# Altium schematic sheet Power-Sheet.SchDoc (part 2 of 2)
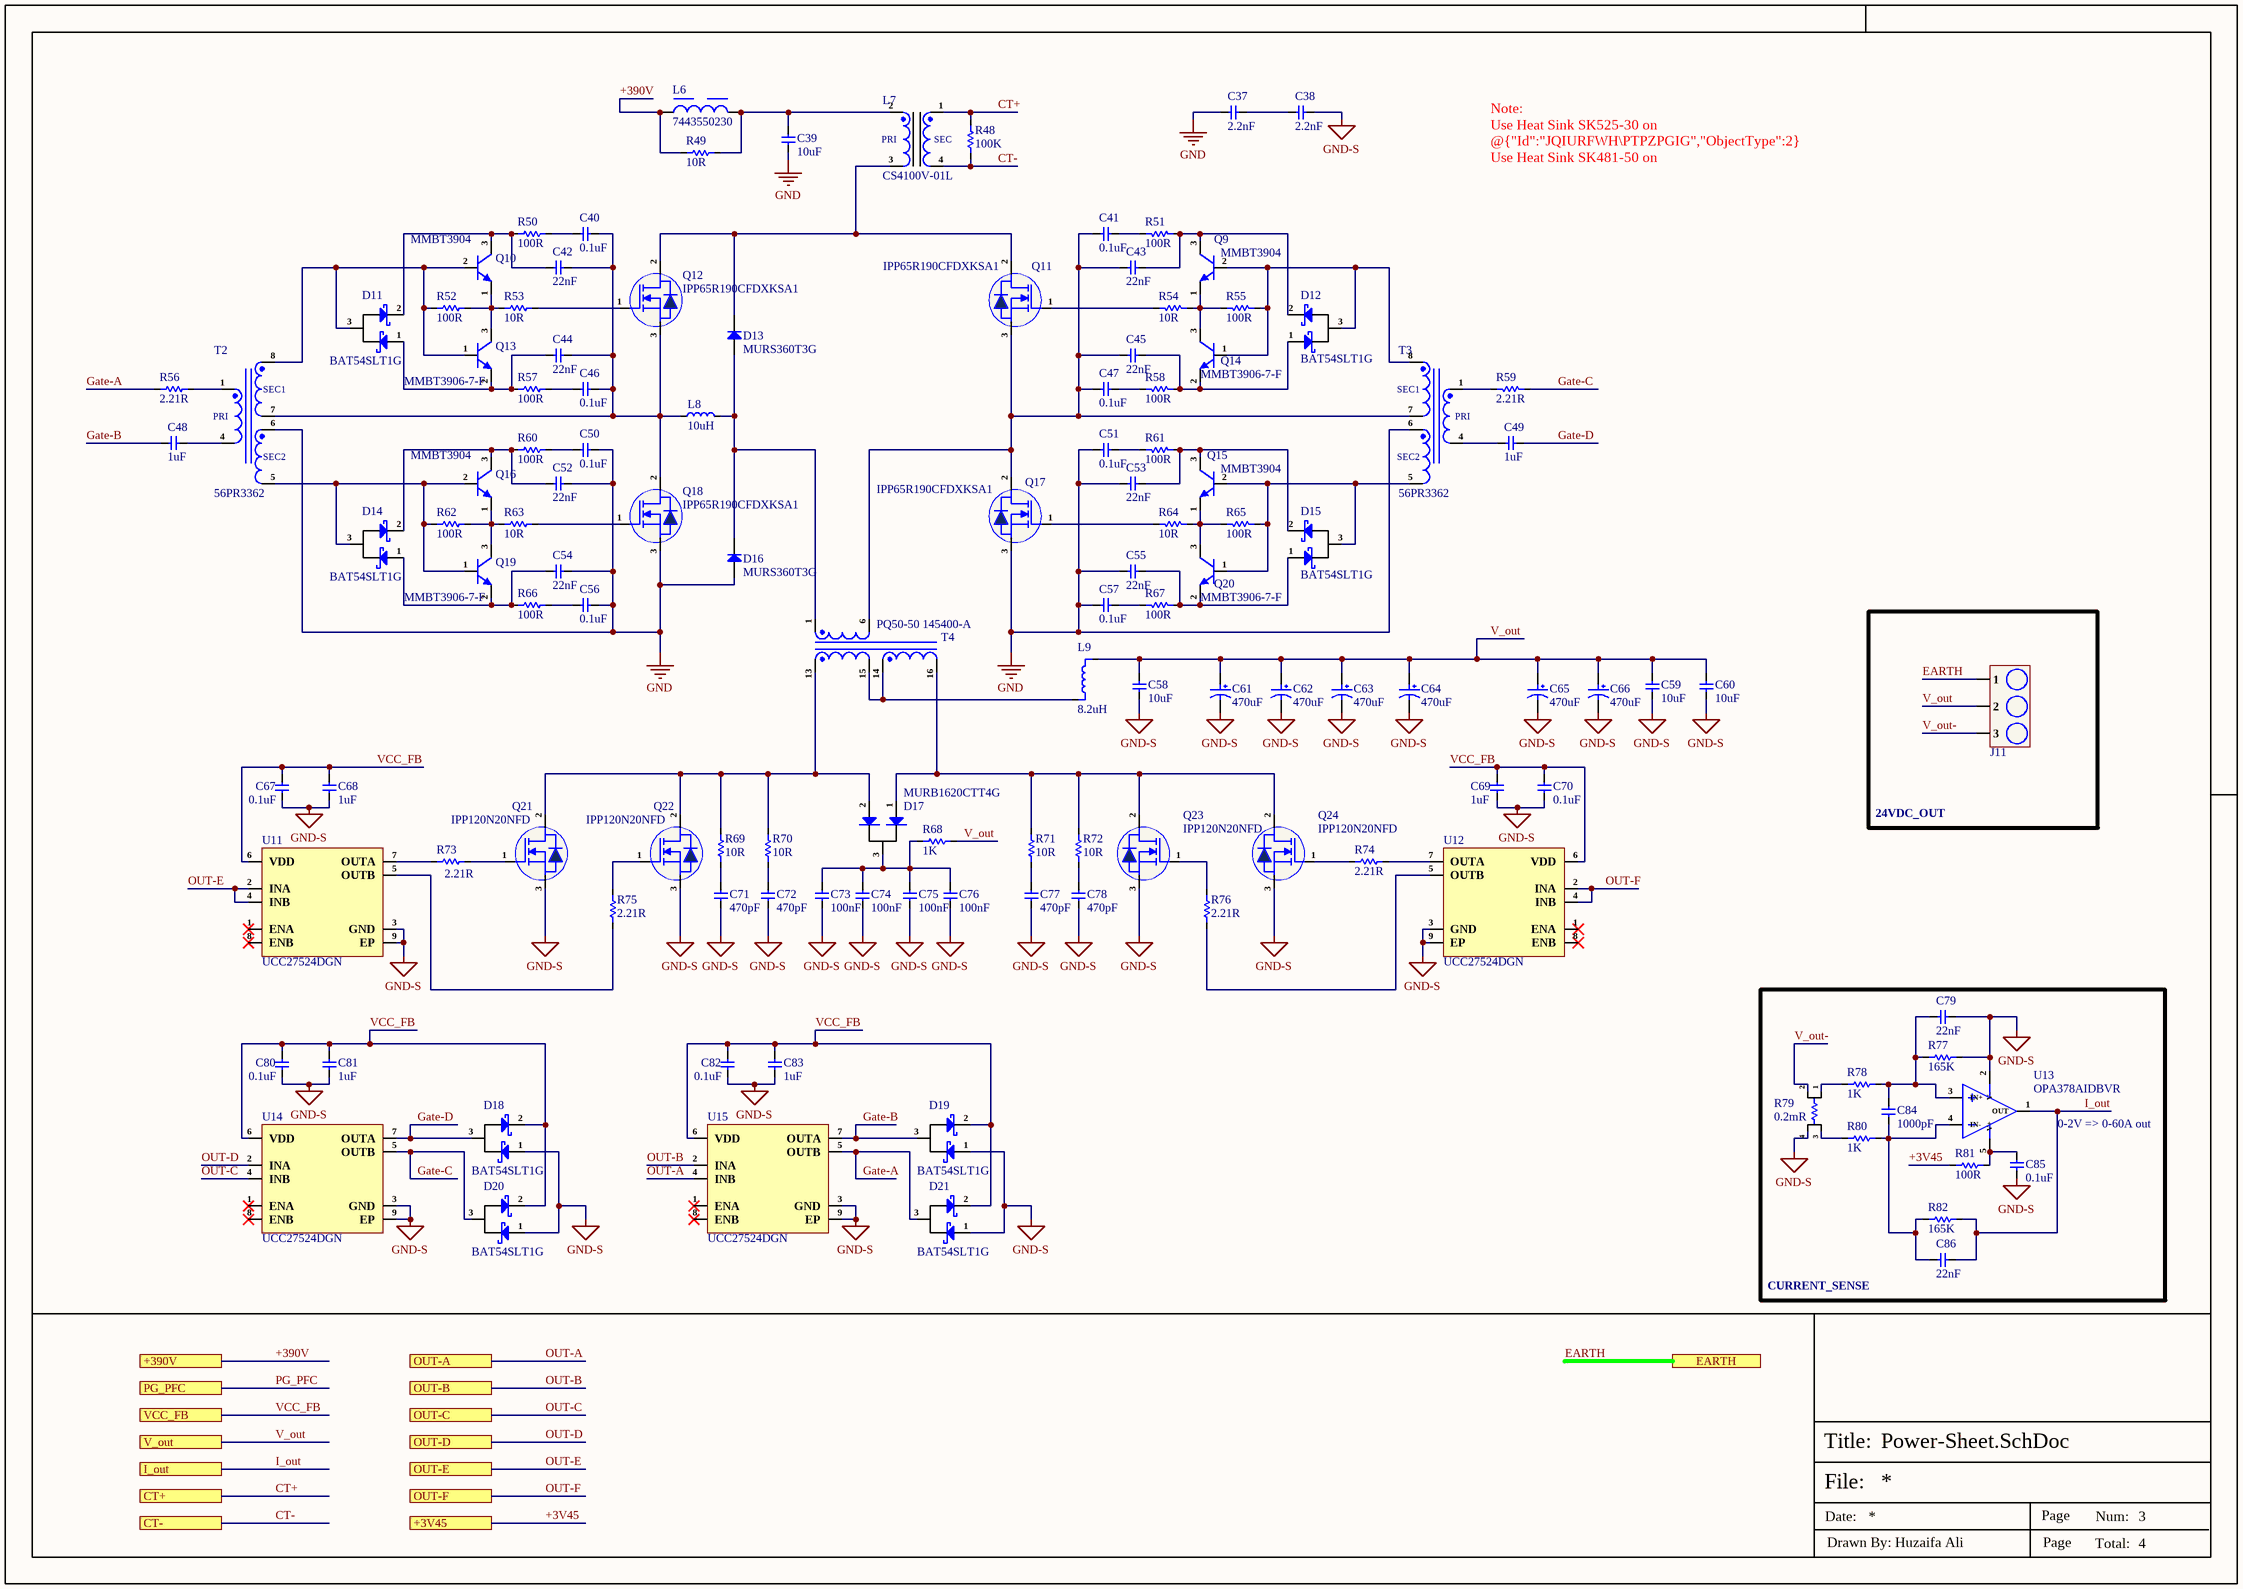
[diagram p1: Power-Sheet.SchDoc]

## Library data of the parts
C37 C38 = DE1E3RA222MN4AP01F: CAP CER 2200PF 1.5KV RADIAL; Manufacturer: Murata; Item Type: Capacitors; Supplier: Future Electronics; LCSC Part Number: C1622500; Manufacturer Part Number: DE1E3RA222MN4AP01F; RoHS: Yes; Stock: 1200; Pricing: 600=0.0835, 2400=0.0795, 9000=0.0758, 18000=0.074, 45000=0.0699 (USD); ComponentLink1URL: https://search.murata.co.jp/Ceramy/image/img/A01X/G101/ENG/DE1_RA_P01F_E.pdf?src-supplier=Digikey; ComponentLink1Description: https://search.murata.co.jp/Ceramy/image/img/A01X/G101/ENG/DE1_RA_P01F_E.pdf?src-supplier=Digikey; ComponentLink2URL: http://search.murata.co.jp/Ceramy/image/img/A01X/G101/ENG/DE1_RA_P01F_E.pdf?src-supplier=Digikey; ComponentLink2Description: http://search.murata.co.jp/Ceramy/image/img/A01X/G101/ENG/DE1_RA_P01F_E.pdf?src-supplier=Digikey
C39 = B32774X5106K000: FILM CAP MKP DC FILTERING - 600V; Manufacturer: TDK; Item Type: Capacitor; Supplier: Digikey; Supplier Part Number: 495-B32774X5106K000-ND; Manufacturer Part Number: B32774X5106K000; RoHS: No; Pricing: 1=4.3, 10=2.896, 50=2.3266, 224=1.97978, 672=1.80198, 1120=1.77575 (USD)
C40 C41 C46 C47 C50 C51 C56 C57 C67 C70 C80 C82 C85 = CL10B104KB8WPNC: CAP CER 0.1UF 50V X7R 0603; Item Type: Capacitor; Material: 4241ConductorMaterial; Value: 100nF; Tolerance: 10%; LCSC Part Number: C307348; ComponentLink1Description: LCSC; Supplier: Rs; Supplier Part Number: 2575919; RoHS: Yes; Category: Ceramic Capacitors; Stock: 400; Pricing: 100=0.021, 500=0.019, 1000=0.015, 2000=0.01 (GBP); Mounting Technology: Surface Mount; Case/Package: 0603; Case Code (Metric): 1608; Case Code (Imperial): 0603; Min Operating Temperature: -55°C; Max Operating Temperature: 125°C; Packaging: Cut Tape; Voltage Rating: 50V; Series: CL; Voltage Rating (DC): 50V; Height: 900um; Ratings: AEC-Q200; RoHS Compliant: Yes; Lead Free: 5697LeadFree; ComponentLink2URL: http://www.farnell.com/datasheets/2710560.pdf?src-supplier=Farnell; ComponentLink2Description: http://www.farnell.com/datasheets/2710560.pdf?src-supplier=Farnell; ComponentLink3URL: http://www.samsungsem.com/kr/support/product-search/mlcc/CL10B104KB8WPNC.jsp?src-supplier=Digi-Key; ComponentLink3Description: http://www.samsungsem.com/kr/support/product-search/mlcc/CL10B104KB8WPNC.jsp?src-supplier=Digi-Key; ComponentLink4URL: http://www.farnell.com/datasheets/2710560.pdf?src-supplier=Element14; ComponentLink4Description: http://www.farnell.com/datasheets/2710560.pdf?src-supplier=Element14; ComponentLink5URL: https://datasheet.octopart.com/CL10B104KB8WPNC-Samsung-Electro-Mechanics-datasheet-120093645.pdf?src-supplier=Future+Electronics; ComponentLink5Description: https://datasheet.octopart.com/CL10B104KB8WPNC-Samsung-Electro-Mechanics-datasheet-120093645.pdf?src-supplier=Future+Electronics; ComponentLink6URL: http://www.farnell.com/datasheets/2710560.pdf?src-supplier=Newark; ComponentLink6Description: http://www.farnell.com/datasheets/2710560.pdf?src-supplier=Newark; ComponentLink7URL: http://www.samsungsem.com/servlet/FileDownload?type=spec&file=CL10B104KB8WPNC.pdf&src-supplier=Avnet; ComponentLink7Description: http://www.samsungsem.com/servlet/FileDownload?type=spec&file=CL10B104KB8WPNC.pdf&src-supplier=Avnet; ComponentLink8URL: https://datasheet.octopart.com/CL10B104KB8WPNC-Samsung-datasheet-8326407.pdf?src-supplier=TME; ComponentLink8Description: https://datasheet.octopart.com/CL10B104KB8WPNC-Samsung-datasheet-8326407.pdf?src-supplier=TME
C42-C45 C52-C55 C79 C86 = CGA3E2X7R2A223K080AA: CAP CER 0.022UF 100V X7R 0603; Manufacturer: TDK; Tolerance: 10%; Item Type: Capacitor; Supplier 1: Digi-Key; Manufacturer Part Number: CGA3E2X7R2A223K080AA; RoHS: Yes; Category: Ceramic Capacitors; Stock 1: 56079; Pricing 1: 1=0.11000, 10=0.07600, 50=0.04340, 100=0.03590, 500=0.02516, 1000=0.02083 (USD); Mount: Surface Mount; Case/Package: 0603; Case Code (Metric): 1608; Case Code (Imperial): 0603; Weight: 7.1E-05oz; Min Operating Temperature: -55°C; Max Operating Temperature: 125°C; Capacitance: 22nF; Voltage Rating: 100V; Packaging: Tape and Reel; Voltage Rating (DC): 100V; Dielectric: X7R; Termination: SMD/SMT; Series: CGA; Package Quantity: 1; Resistor Type: Ceramic; Length: 1.6mm; Width: 0.031inch; Height: 0.8mm; Thickness: 0.035inch; Depth: 0.8mm; Ratings: AEC-Q200; RoHS Compliant: Yes; REACH SVHC: No SVHC; ComponentLink1URL: https://datasheet.ciiva.com/22725/1735406-22725648.pdf?src-supplier=Element14; ComponentLink1Description: https://datasheet.ciiva.com/22725/1735406-22725648.pdf?src-supplier=Element14; ComponentLink2URL: https://datasheet.ciiva.com/24218/cga3e2x7r2a223k080aa-266292-24218959.pdf?src-supplier=Mouser; ComponentLink2Description: https://datasheet.ciiva.com/24218/cga3e2x7r2a223k080aa-266292-24218959.pdf?src-supplier=Mouser; ComponentLink3URL: https://datasheet.ciiva.com/7975/1807242-7975349.pdf?src-supplier=Element14; ComponentLink3Description: https://datasheet.ciiva.com/7975/1807242-7975349.pdf?src-supplier=Element14; Supplier Part Number 1: 445-5814-1-ND; LCSC Part Number: C2167165
C48 C49 C68 C69 C81 C83 = C1608X7R1E105K080AB: CAP CER 1UF 25V X7R 0603; Manufacturer: TDK; Item Type: Capacitors; Material: 4241ConductorMaterial; Tolerance: 10%; Supplier: Digikey; Manufacturer Part Number: C1608X7R1E105K080AB; RoHS: Yes; Stock: 239206; Pricing: 1=0.18, 10=0.103, 50=0.0722, 100=0.0627, 500=0.04664, 1000=0.04163 (USD); Mounting Technology: Surface Mount; Case/Package: 0603; Case Code (Metric): 1608; Case Code (Imperial): 0603; Dielectric Material: 4241ConductorMaterial; Min Operating Temperature: -55°C; Max Operating Temperature: 125°C; Value: 1uF; Package Quantity: 1; Voltage Rating: 25V; Packaging: Tape and Reel; Dielectric: X7R; Voltage: 25V; Series: C; Construction: Flat; Length: 1.6mm; Width: 0.031inch; Height: 0.8mm; Thickness: 0.037inch; Depth: 0.8mm; Radiation Hardening: No; Reach SVHC Compliant: No; Lead Free: Lead Free; RoHS Compliant: Yes; ComponentLink1URL: https://datasheet.ciiva.com/23802/1796654-23802776.pdf?src-supplier=Newark; ComponentLink1Description: https://datasheet.ciiva.com/23802/1796654-23802776.pdf?src-supplier=Newark; ComponentLink2URL: https://datasheet.ciiva.com/22725/1913358-22725530.pdf?src-supplier=Element14; ComponentLink2Description: https://datasheet.ciiva.com/22725/1913358-22725530.pdf?src-supplier=Element14; ComponentLink3URL: https://datasheet.ciiva.com/28693/mlcc-commercial-general-en-28693447.pdf?src-supplier=Element14; ComponentLink3Description: https://datasheet.ciiva.com/28693/mlcc-commercial-general-en-28693447.pdf?src-supplier=Element14; ComponentLink4URL: https://datasheet.ciiva.com/6290/tdkmlcccaprange-6290854.pdf?src-supplier=Digikey; ComponentLink4Description: https://datasheet.ciiva.com/6290/tdkmlcccaprange-6290854.pdf?src-supplier=Digikey; ComponentLink5URL: https://datasheet.ciiva.com/26834/getdatasheetpartid-727834-26834380.pdf?src-supplier=Verical; ComponentLink5Description: https://datasheet.ciiva.com/26834/getdatasheetpartid-727834-26834380.pdf?src-supplier=Verical
C58-C60 = GRM32ER71H106KA12L: CAP CER 10UF 50V X7R 1210; Manufacturer: Murata; Item Type: Capacitors; Supplier: Future Electronics; LCSC Part Number: C77102; Manufacturer Part Number: GRM32ER71H106KA12L; RoHS: Yes; Stock: 960000; Pricing: 1000=0.325, 2000=0.32, 3000=0.315, 4000=0.315, 5000=0.305 (USD); Lead Free: 5697LeadFree; RoHS Compliant: 5897YesNo; ComponentLink1URL: https://datasheet.ciiva.com/16497/product-16497010.pdf?src-supplier=Future+Electronics; ComponentLink1Description: https://datasheet.ciiva.com/16497/product-16497010.pdf?src-supplier=Future+Electronics; ComponentLink2URL: https://datasheet.ciiva.com/3777/4286grm32er71h106ka1223-3777306.pdf?src-supplier=Arrow+Electronics; ComponentLink2Description: https://datasheet.ciiva.com/3777/4286grm32er71h106ka1223-3777306.pdf?src-supplier=Arrow+Electronics; ComponentLink3URL: https://datasheet.ciiva.com/11789/0900766b80ef921d-11789081.pdf?src-supplier=Rs; ComponentLink3Description: https://datasheet.ciiva.com/11789/0900766b80ef921d-11789081.pdf?src-supplier=Rs; ComponentLink4URL: https://datasheet.ciiva.com/11607/c02e-11607596.pdf?src-supplier=Avnet; ComponentLink4Description: https://datasheet.ciiva.com/11607/c02e-11607596.pdf?src-supplier=Avnet; ComponentLink5URL: https://datasheet.ciiva.com/6270/partnumbering-e-01-6270167.pdf?src-supplier=Digikey; ComponentLink5Description: https://datasheet.ciiva.com/6270/partnumbering-e-01-6270167.pdf?src-supplier=Digikey; ComponentLink6URL: https://datasheet.ciiva.com/6270/partnumbering-e-01-6270168.pdf?src-supplier=Digikey; ComponentLink6Description: https://datasheet.ciiva.com/6270/partnumbering-e-01-6270168.pdf?src-supplier=Digikey; ComponentLink7URL: https://datasheet.ciiva.com/6270/partnumbering-e-01-6270169.pdf?src-supplier=Digikey; ComponentLink7Description: https://datasheet.ciiva.com/6270/partnumbering-e-01-6270169.pdf?src-supplier=Digikey; ComponentLink8URL: https://datasheet.ciiva.com/46441/1754714-46441340.pdf?src-supplier=Element14; ComponentLink8Description: https://datasheet.ciiva.com/46441/1754714-46441340.pdf?src-supplier=Element14
C61-C66 = EKZM500ELL471MK20S: CAP ALUM 50V POLAR; Manufacturer: United Chemi-Con; Tolerance: 20%; Dissipation Factor: 0.1%; Supplier: Digikey; Supplier Part Number: 565-EKZM500ELL471MK20S-ND; Manufacturer Part Number: EKZM500ELL471MK20S; RoHS: Yes; Category: Aluminum Electrolytic Capacitors; Stock: 1959; Pricing: 1=1.02, 10=0.631, 50=0.4744, 100=0.4255, 500=0.34218, 1000=0.31616, 3000=0.28378, 5000=0.27172 (USD); Case/Package: Aluminum; Min Operating Temperature: -40°C; Max Operating Temperature: 105°C; Packaging: Bulk; Voltage Rating: 50V; Value: 470uF; Termination: Radial; Series: KZM; Length: 20mm; RoHS Compliant: Yes; ComponentLink1URL: http://www.mouser.com/ds/2/420/15133587752d6c58fb020c-1090524.pdf?src-supplier=Mouser; ComponentLink1Description: http://www.mouser.com/ds/2/420/15133587752d6c58fb020c-1090524.pdf?src-supplier=Mouser
C71 C72 C77 C78 = CC1206KKX7RBBB471: CAP CER 470PF 500V X7R 1206; Manufacturer: Yageo; Item Type: Capacitors; Supplier: Future Electronics; LCSC Part Number: C513662; Manufacturer Part Number: CC1206KKX7RBBB471; RoHS: Yes; Stock: 75000; Pricing: 3000=0.0149, 12000=0.0145, 30000=0.0142, 75000=0.014, 120000=0.0136 (USD); Lead Free: 5697LeadFree; ComponentLink1URL: https://datasheet.ciiva.com/26918/getdatasheetpartid-411464-26918346.pdf?src-supplier=Verical; ComponentLink1Description: https://datasheet.ciiva.com/26918/getdatasheetpartid-411464-26918346.pdf?src-supplier=Verical; ComponentLink2URL: https://datasheet.ciiva.com/16743/upy-np0x7r-mv-100-to-630v-9-16743389.pdf?src-supplier=Future+Electronics; ComponentLink2Description: https://datasheet.ciiva.com/16743/upy-np0x7r-mv-100-to-630v-9-16743389.pdf?src-supplier=Future+Electronics; ComponentLink3URL: https://datasheet.ciiva.com/29534/mlccorderingcode-29534108.pdf?src-supplier=Digikey; ComponentLink3Description: https://datasheet.ciiva.com/29534/mlccorderingcode-29534108.pdf?src-supplier=Digikey; ComponentLink4URL: https://datasheet.ciiva.com/13209/upy-gp-np0-16v-to-50v-8-13209817.pdf?src-supplier=Mouser; ComponentLink4Description: https://datasheet.ciiva.com/13209/upy-gp-np0-16v-to-50v-8-13209817.pdf?src-supplier=Mouser; ComponentLink5URL: https://datasheet.ciiva.com/11466/upy-np0x7r-mv-100-to-630v-9-11466693.pdf?src-supplier=Avnet; ComponentLink5Description: https://datasheet.ciiva.com/11466/upy-np0x7r-mv-100-to-630v-9-11466693.pdf?src-supplier=Avnet
C73-C76 = C3216X7R2E104KT0L0U: 250V 100nF X7R ±10% 1206 Multilayer Ceramic Capacitors MLCC - SMD/SMT ROHS; Manufacturer: TDK; Manufacturer Part Number: C3216X7R2E104KT0L0U; Package: 1206; LCSC Part Number: C76671; Item Type: Capacitor; ComponentLink1Description: LCSC; ComponentLink1URL: https://www.lcsc.com/product-detail/Multilayer-Ceramic-Capacitors-MLCC-SMD-SMT_TDK-C3216X7R2E104KT0L0U_C76671.html
C84 = CL10C102JB8NNNC: CAP CER 1000PF 50V C0G/NP0 0603; Manufacturer: Samsung; Material: Ceramic; Tolerance: 5%; Capacitance: 1nF; Dielectric: C0G; Temperature Coefficient: 300ppm/°C; Item Type: Capacitor; Supplier 1: RSComponents; Manufacturer Part Number: CL10C102JB8NNNC; RoHS: Yes; Category: Ceramic Capacitors; Stock 1: 616000; Pricing 1: 4000=0.00600, 12000=0.00600, 20000=0.00600, 40000=0.00500, 100000=0.00500 (GBP); Mount: Surface Mount; Case/Package: 0603; Case Code (Metric): 1608; Case Code (Imperial): 0603; Min Operating Temperature: -55°C; Max Operating Temperature: 125°C; Voltage: 50V; Voltage Rating (DC): 50V; Voltage Rating: 50V; Packaging: Tape and Reel; Package Quantity: 1; Series: CL; Length: 1.6mm; Width: 0.031inch; Height: 0.8mm; Depth: 0.8mm; Thickness: 0.035inch; Radiation Hardening: No; Lead Free: Lead Free; RoHS Compliant: Yes; ComponentLink1URL: https://datasheet.ciiva.com/15195/getdatasheetpartid-354056-15195790.pdf?src-supplier=Verical; ComponentLink1Description: https://datasheet.ciiva.com/15195/getdatasheetpartid-354056-15195790.pdf?src-supplier=Verical; ComponentLink2URL: https://datasheet.ciiva.com/29198/458273-da-01-en-vs-kondensator-0603-29198494.pdf?src-supplier=Conrad; ComponentLink2Description: https://datasheet.ciiva.com/29198/458273-da-01-en-vs-kondensator-0603-29198494.pdf?src-supplier=Conrad; ComponentLink3URL: https://datasheet.ciiva.com/26310/mlcc-catalogdownload2013-eng-26310329.pdf?src-supplier=Distrelec; ComponentLink3Description: https://datasheet.ciiva.com/26310/mlcc-catalogdownload2013-eng-26310329.pdf?src-supplier=Distrelec; Supplier Part Number 1: 7665279; LCSC Part Number: C163508
D11 D12 D14 D15 D18-D21 = BAT54SLT1G: DIODE ARR SCHOTT 30V 200MA SOT23; Manufacturer: ON Semiconductor; Max Surge Current: 600mA; Forward Voltage: 800mV; Max Reverse Current: 2uA; Recovery Time: 5ns; Element Configuration: Dual; Peak Non-Repetitive Surge Current: 1A; Power Dissipation: 225mW; Value: 7.6pF; Supplier: Future Electronics; LCSC Part Number: C19726; Manufacturer Part Number: BAT54SLT1G; RoHS: No; Item Type: Diode; Stock: 10110000; Pricing: 3000=0.0141, 12000=0.0135, 30000=0.0131, 75000=0.0128, 120000=0.0122 (USD); Case/Package: SOT-23-3; Pins: 3; Min Operating Temperature: -55°C; Max Operating Temperature: 150°C; Forward Current: 200mA; Packaging: Tape and Reel; Max Repetitive Reverse Voltage (Vrrm): 30V; Current Rating: 200mA; Voltage Rating (DC): 30V; Package Quantity: 1; Average Rectified Current: 200mA; Reverse Recovery Time: 5ns; Max Reverse Leakage Current: 2uA; Max Forward Surge Current (Ifsm): 600mA; Max Reverse Voltage (DC): 30V; Series: -; Reverse Voltage: 30V; Length: 2.9mm; Width: 1.3mm; Height: 0.94mm; Radiation Hardening: No; Lead Free: Lead Free; Halogen Free: Halogen Free; Reach SVHC Compliant: No; ComponentLink1URL: https://datasheet.ciiva.com/1180/bat54slt1-d-1180304.pdf?src-supplier=Element14; ComponentLink1Description: https://datasheet.ciiva.com/1180/bat54slt1-d-1180304.pdf?src-supplier=Element14; ComponentLink2URL: https://datasheet.ciiva.com/1180/bat54slt1-d-1180305.pdf?src-supplier=Element14; ComponentLink2Description: https://datasheet.ciiva.com/1180/bat54slt1-d-1180305.pdf?src-supplier=Element14; ComponentLink3URL: https://datasheet.ciiva.com/14558/70099484-14558437.pdf?src-supplier=Allied+Electronics; ComponentLink3Description: https://datasheet.ciiva.com/14558/70099484-14558437.pdf?src-supplier=Allied+Electronics
D13 D16 = MURS360T3G: SMC(DO-214AB) Diodes - Fast Recovery Rectifiers ROHS; Manufacturer: FUXINSEMI; Manufacturer Part Number: MURS360T3G; Package: SMC(DO-214AB); LCSC Part Number: C7436549; Item Type: Diodes; ComponentLink1Description: LCSC; ComponentLink1URL: https://www.lcsc.com/product-detail/Diodes-Fast-Recovery-Rectifiers_FUXINSEMI-MURS360T3G_C7436549.html
D17 = MURB1620CTT4G: DIODE ARRAY GP 200V 8A D2PAK; Manufacturer: ON Semiconductor; Supplier: Future Electronics; LCSC Part Number: C236158; Manufacturer Part Number: MURB1620CTT4G; RoHS: Yes; Item Type: Diode; Stock: 72800; Pricing: 800=0.64, 1600=0.625, 2400=0.615, 3200=0.61, 4000=0.59 (USD); ComponentLink1URL: https://datasheet.ciiva.com/906/murb1620ct-d-906005.pdf?src-supplier=Digikey; ComponentLink1Description: https://datasheet.ciiva.com/906/murb1620ct-d-906005.pdf?src-supplier=Digikey; ComponentLink2URL: https://datasheet.ciiva.com/16293/murb1620ct-d-16293538.pdf?src-supplier=Future+Electronics; ComponentLink2Description: https://datasheet.ciiva.com/16293/murb1620ct-d-16293538.pdf?src-supplier=Future+Electronics; ComponentLink3URL: https://datasheet.ciiva.com/8292/murb1620ct-d-8292357.pdf?src-supplier=Avnet; ComponentLink3Description: https://datasheet.ciiva.com/8292/murb1620ct-d-8292357.pdf?src-supplier=Avnet; ComponentLink4URL: https://datasheet.ciiva.com/906/murb1620ct-d-906006.pdf?src-supplier=Digikey; ComponentLink4Description: https://datasheet.ciiva.com/906/murb1620ct-d-906006.pdf?src-supplier=Digikey; ComponentLink5URL: https://datasheet.ciiva.com/906/murb1620ct-d-906007.pdf?src-supplier=Digikey; ComponentLink5Description: https://datasheet.ciiva.com/906/murb1620ct-d-906007.pdf?src-supplier=Digikey
J11 = KF88SM-16.0-3P: 1x3P With Cover Plate 3 1 16mm -40℃~+105℃ 76A 1kV Black 6~14 Straight Needle 16 Plugin,P=16mm Barrier Terminal Blocks ROHS; Manufacturer: Cixi Kefa Elec; Manufacturer Part Number: KF88SM-16.0-3P; Package: Plugin,P=16mm; LCSC Part Number: C707770; Item Type: Terminal Block; ComponentLink1Description: LCSC; ComponentLink1URL: https://www.lcsc.com/product-detail/Barrier-Terminal-Blocks_Cixi-Kefa-Elec-KF88SM-16-0-3P_C707770.html
L6 = 7443550230: FIXED IND 2.3UH 17.5A 3.7MOHM SM; Manufacturer: Wurth Electronics; Item Type: Inductors; Supplier: Digikey; Supplier Part Number: 732-7443550230CT-ND; Manufacturer Part Number: 7443550230; RoHS: Yes; Stock: 2613; Pricing: 1=3.48, 10=3.41, 50=3.15, 100=3.02, 200=2.82 (USD); ComponentLink1URL: https://datasheet.ciiva.com/4954/7443550230-82185-4954542.pdf?src-supplier=Mouser; ComponentLink1Description: https://datasheet.ciiva.com/4954/7443550230-82185-4954542.pdf?src-supplier=Mouser; ComponentLink2URL: https://datasheet.ciiva.com/11801/0900766b80f886e1-11801808.pdf?src-supplier=Rs; ComponentLink2Description: https://datasheet.ciiva.com/11801/0900766b80f886e1-11801808.pdf?src-supplier=Rs; ComponentLink3URL: https://datasheet.ciiva.com/7765/1735881-7765096.pdf?src-supplier=Element14; ComponentLink3Description: https://datasheet.ciiva.com/7765/1735881-7765096.pdf?src-supplier=Element14; ComponentLink4URL: https://datasheet.ciiva.com/6705/7443550230-6705035.pdf?src-supplier=Digikey; ComponentLink4Description: https://datasheet.ciiva.com/6705/7443550230-6705035.pdf?src-supplier=Digikey; ComponentLink5URL: https://datasheet.ciiva.com/6705/7443550230-6705036.pdf?src-supplier=Digikey; ComponentLink5Description: https://datasheet.ciiva.com/6705/7443550230-6705036.pdf?src-supplier=Digikey
L7 = CS4100V-01L: Transformer, Current Sense, 1: 100, 24A; Manufacturer: Coilcraft; Item Type: Inductors; Turns Ratio: 1:100; DC Resistance (DCR): 7mR; Value: 20mH; Supplier: Mouser; Supplier Part Number: 994-CS4100V-01L; Manufacturer Part Number: CS4100V-01L; RoHS: Yes; Stock: 520; Pricing: 1=11.28, 10=11.28, 50=11.28, 100=11.28, 1000=5.53, 10000=5.14 (USD); Primary Current: 24A; Packaging: Rail/Tube; Package Quantity: 29; Series: CS4xxx; Reach SVHC Compliant: No; Lead Free: Contains Lead; RoHS Compliant: Yes; ComponentLink1URL: http://www.mouser.com/ds/2/597/senhitr-463493.pdf?src-supplier=Mouser; ComponentLink1Description: http://www.mouser.com/ds/2/597/senhitr-463493.pdf?src-supplier=Mouser; ComponentLink2URL: http://www.farnell.com/datasheets/1870394.pdf?src-supplier=Farnell; ComponentLink2Description: http://www.farnell.com/datasheets/1870394.pdf?src-supplier=Farnell; ComponentLink3URL: http://www.farnell.com/datasheets/1870394.pdf?src-supplier=Element14; ComponentLink3Description: http://www.farnell.com/datasheets/1870394.pdf?src-supplier=Element14
L8 = CSBL1809-100M: SMD HIGH CURRENT POWER INDUCTOR; Manufacturer: Codaca; Supplier: DigiKey; Supplier Part Number: 4044-CSBL1809-100MCT-ND; Manufacturer Part Number: CSBL1809-100M; RoHS: No; Category: Fixed Inductors; Stock: 69; Pricing: 1=4.25, 10=3.304, 25=2.986, 50=2.7654 (USD)
L9 = CPRX3231L-8R2MC: THT HIGH CURRENT POWER INDUCTOR; Manufacturer: Codaca; Item Type: INDUCTOR; Manufacturer Part Number: CPRX3231L-8R2MC; RoHS: No; Stock: 21; Pricing: 1=20.99, 10=16.268, 25=14.688, 40=13.93475, 80=12.88975, 230=12.5 (USD)
Q9 Q10 Q15 Q16 = MMBT3904: 40V 200mW 100 200mA NPN SOT-23 Bipolar (BJT) ROHS; Manufacturer: ElecSuper; Item Type: (BJT); Manufacturer Part Number: MMBT3904; Package: SOT-23; LCSC Part Number: C5249683; ComponentLink1Description: LCSC; ComponentLink1URL: https://www.lcsc.com/product-detail/Bipolar-BJT_ElecSuper-MMBT3904_C5249683.html
Q11 Q12 Q17 Q18 = IPP65R190CFDXKSA1: MOSFET N-CH 650V 14A TO220-3; Manufacturer: Infineon; Item Type: MOSFETs; On-State Resistance: 190mR; Supplier: Mouser; LCSC Part Number: 726-IPP65R190CFD; Manufacturer Part Number: IPP65R190CFDXKSA1; RoHS: Yes; Stock: 410; Pricing: 1=3.7, 10=3.11, 50=2.93, 100=2.51, 1000=1.91, 10000=1.8 (USD); Max Dual Supply Voltage: 650V; Lead Free: 5697LeadFree; ComponentLink1URL: https://datasheet.ciiva.com/952/infineon-ipx65r190cfd-ds-v02-07-en-952136.pdf?src-supplier=Digikey; ComponentLink1Description: https://datasheet.ciiva.com/952/infineon-ipx65r190cfd-ds-v02-07-en-952136.pdf?src-supplier=Digikey
Q13 Q14 Q19 Q20 = MMBT3906-7-F: TRANS PNP 40V 0.2A SOT23-3; Manufacturer: Diodes Zetex; Item Type: BJTs; Voltage Rating (DC): -40V; Current Rating: -200mA; Supplier: Future Electronics; LCSC Part Number: C82762; Manufacturer Part Number: MMBT3906-7-F; RoHS: Yes; Stock: 567000; Pricing: 3000=0.0143, 12000=0.0137, 30000=0.0112, 45000=0.0131, 75000=0.0109, 120000=0.0128, 300000=0.0121 (USD); Lead Free: 5697LeadFree; ComponentLink1URL: https://datasheet.ciiva.com/27052/1540746-27052408.pdf?src-supplier=Jameco; ComponentLink1Description: https://datasheet.ciiva.com/27052/1540746-27052408.pdf?src-supplier=Jameco; ComponentLink2URL: https://datasheet.ciiva.com/15139/getdatasheetpartid-255292-15139821.pdf?src-supplier=Verical; ComponentLink2Description: https://datasheet.ciiva.com/15139/getdatasheetpartid-255292-15139821.pdf?src-supplier=Verical
Q21-Q24 = IPP120N20NFD: MOSFET N-CH 200V 84A TO220-3; Manufacturer: Infineon; Item Type: MOSFETs; Supplier: Future Electronics; LCSC Part Number: C537163; Manufacturer Part Number: IPP120N20NFD; RoHS: Yes; Stock: 2450; Pricing: 50=2.03, 1000=2, 1500=1.98, 2000=1.97, 2500=1.93 (USD); Case/Package: TO-220-3; Pins: 3; Packaging: Rail/Tube; Halogen Free: Halogen Free; Reach SVHC Compliant: Yes; Lead Free: Lead Free; RoHS Compliant: Yes; ComponentLink1URL: http://www.farnell.com/datasheets/1932551.pdf?src-supplier=Element14; ComponentLink1Description: http://www.farnell.com/datasheets/1932551.pdf?src-supplier=Element14
R48 = RC0805FR-07100KL: RES 100K OHM 1% 1/8W 0805; Manufacturer: Yageo; Resistance: 100kR; Power Rating: 125mW; Voltage Rating (DC): 150V; Temperature Coefficient: 100ppm/°C; Item Type: Resistor; Supplier 1: Avnet; Manufacturer Part Number: RC0805FR-07100KL; RoHS: Yes; Category: Chip SMD Resistors; Stock 1: 695000; Pricing 1: 5000=0.00227, 10000=0.00224, 20000=0.00217 (USD); Case/Package: 0805; Number of Pins: 2; Case Code (Metric): 2012; Case Code (Imperial): 0805; Size Code: 0805; Min Operating Temperature: -55°C; Max Operating Temperature: 155°C; Resistor Type: Thick Film; Tolerance: 1%; Packaging: Tape and Reel; Voltage Rating: 150V; Package Quantity: 1; Number of Terminations: 2; Termination: SMD/SMT; Max Power Dissipation: 125mW; Features: Moisture Resistant; Series: RC; Construction: Rectangular; Resistance Tolerance: 1%; Technology: THICK FILM; Length: 0.079inch; Width: 0.049inch; Height: 0.024inch; Depth: 1.25mm; Lead Pitch: 0.4mm; Lead Free: Lead Free; RoHS Compliant: Yes; Military Standard: Not; ComponentLink1URL: https://datasheet.ciiva.com/11808/0900766b8106beab-11808858.pdf?src-supplier=RSComponents; ComponentLink1Description: https://datasheet.ciiva.com/11808/0900766b8106beab-11808858.pdf?src-supplier=RSComponents; ComponentLink2URL: https://datasheet.ciiva.com/7941/1686128-7941677.pdf?src-supplier=Element14; ComponentLink2Description: https://datasheet.ciiva.com/7941/1686128-7941677.pdf?src-supplier=Element14; ComponentLink3URL: https://datasheet.ciiva.com/7660/38627-7660796.pdf?src-supplier=Element14; ComponentLink3Description: https://datasheet.ciiva.com/7660/38627-7660796.pdf?src-supplier=Element14; ComponentLink4URL: https://datasheet.ciiva.com/22747/444164-22747534.pdf?src-supplier=Element14; ComponentLink4Description: https://datasheet.ciiva.com/22747/444164-22747534.pdf?src-supplier=Element14; ComponentLink5URL: https://datasheet.ciiva.com/2457/pyu-r-int-thick-7-2457018.pdf?src-supplier=Digi-Key; ComponentLink5Description: https://datasheet.ciiva.com/2457/pyu-r-int-thick-7-2457018.pdf?src-supplier=Digi-Key; ComponentLink6URL: https://datasheet.ciiva.com/2457/pyu-r-int-thick-7-2457019.pdf?src-supplier=Digi-Key; ComponentLink6Description: https://datasheet.ciiva.com/2457/pyu-r-int-thick-7-2457019.pdf?src-supplier=Digi-Key; ComponentLink7URL: https://datasheet.ciiva.com/2457/pyu-r-int-thick-7-2457017.pdf?src-supplier=Digi-Key; ComponentLink7Description: https://datasheet.ciiva.com/2457/pyu-r-int-thick-7-2457017.pdf?src-supplier=Digi-Key; ComponentLink8URL: https://datasheet.ciiva.com/12667/rc0805-12667001.pdf?src-supplier=Mouser; ComponentLink8Description: https://datasheet.ciiva.com/12667/rc0805-12667001.pdf?src-supplier=Mouser; ComponentLink9URL: https://datasheet.ciiva.com/7941/1697719-7941676.pdf?src-supplier=Element14; ComponentLink9Description: https://datasheet.ciiva.com/7941/1697719-7941676.pdf?src-supplier=Element14; ComponentLink10URL: https://datasheet.ciiva.com/7941/1697719-7941678.pdf?src-supplier=Element14; ComponentLink10Description: https://datasheet.ciiva.com/7941/1697719-7941678.pdf?src-supplier=Element14; ComponentLink11URL: https://datasheet.ciiva.com/16747/rc0805-16747226.pdf?src-supplier=Future+Electronics; ComponentLink11Description: https://datasheet.ciiva.com/16747/rc0805-16747226.pdf?src-supplier=Future+Electronics; Supplier Part Number 1: RC0805FR-07100KL; LCSC Part Number: C96346
R49 R69-R72 = RC2010FK-0710RL: RES 10 OHM 1% 3/4W 2010; Manufacturer: Yageo; Item Type: Resistors; Supplier: Future Electronics; LCSC Part Number: C137067; Manufacturer Part Number: RC2010FK-0710RL; RoHS: Yes; Stock: 8000; Pricing: 4000=0.041, 12000=0.0395, 20000=0.0388, 60000=0.0374, 100000=0.0362 (USD); ComponentLink1URL: https://datasheet.ciiva.com/12667/pyu-rc2010-51-rohs-l-4-12667047.pdf?src-supplier=Mouser; ComponentLink1Description: https://datasheet.ciiva.com/12667/pyu-rc2010-51-rohs-l-4-12667047.pdf?src-supplier=Mouser; ComponentLink2URL: https://datasheet.ciiva.com/7672/1563630-7672315.pdf?src-supplier=Element14; ComponentLink2Description: https://datasheet.ciiva.com/7672/1563630-7672315.pdf?src-supplier=Element14; ComponentLink3URL: https://datasheet.ciiva.com/7672/1563630-7672316.pdf?src-supplier=Element14; ComponentLink3Description: https://datasheet.ciiva.com/7672/1563630-7672316.pdf?src-supplier=Element14; ComponentLink4URL: https://datasheet.ciiva.com/17422/pyu-rc2010-51-rohs-l-4-17422060.pdf?src-supplier=Future+Electronics; ComponentLink4Description: https://datasheet.ciiva.com/17422/pyu-rc2010-51-rohs-l-4-17422060.pdf?src-supplier=Future+Electronics
R50-R52 R55 R57 R58 R60-R62 R65-R67 R81 = CRCW0603100RFKEA: RES SMD 100 OHM 1% 1/10W 0603; Manufacturer: Vishay Dale; Item Type: Resistors; Power Rating: 100mW; Voltage Rating: 75V; Temperature Coefficient: 100ppm/°C; Supplier: Mouser; LCSC Part Number: C844917; Manufacturer Part Number: CRCW0603100RFKEA; RoHS: Yes; Stock: 584918; Pricing: 1=0.1, 10=0.017, 50=0.017, 100=0.01, 1000=0.008, 10000=0.004 (USD); Case/Package: 0603; Pins: 2NUMBER; Weight: 7.1E-05oz; Case Code (Metric): 1608; Case Code (Imperial): 0603; Min Operating Temperature: -55°C; Max Operating Temperature: 155°C; Value: 100R; Tolerance: 1%; Resistor Type: Thick Film; Package Quantity: 10; Packaging: Tape and Reel; Number of Terminations: 2; Termination: SMD/SMT; Max Power Dissipation: 100mW; Features: Automotive AEC-Q200; Series: CRCW; Resistance Tolerance: 1%; Voltage Rating (DC): 75V; Construction: Rectangular; Length: 1.55mm; Width: 0.033inch; Height: 0.02inch; Depth: 0.85mm; Ratings: AEC-Q200; Lead Free: 5697LeadFree; RoHS Compliant: Yes; Reach SVHC Compliant: Unknown; Military Standard: Not; ComponentLink1URL: https://datasheet.ciiva.com/22666/1720486-22666207.pdf?src-supplier=Element14; ComponentLink1Description: https://datasheet.ciiva.com/22666/1720486-22666207.pdf?src-supplier=Element14; ComponentLink2URL: https://datasheet.ciiva.com/26316/fld-crcw-e3-data-en-26316566.pdf?src-supplier=Distrelec; ComponentLink2Description: https://datasheet.ciiva.com/26316/fld-crcw-e3-data-en-26316566.pdf?src-supplier=Distrelec; ComponentLink3URL: https://datasheet.ciiva.com/22673/1697337-22673066.pdf?src-supplier=Element14; ComponentLink3Description: https://datasheet.ciiva.com/22673/1697337-22673066.pdf?src-supplier=Element14; ComponentLink4URL: https://datasheet.ciiva.com/2465/dcrcwe3-2465544.pdf?src-supplier=Digikey; ComponentLink4Description: https://datasheet.ciiva.com/2465/dcrcwe3-2465544.pdf?src-supplier=Digikey; ComponentLink5URL: https://datasheet.ciiva.com/2465/dcrcwe3-2465545.pdf?src-supplier=Digikey; ComponentLink5Description: https://datasheet.ciiva.com/2465/dcrcwe3-2465545.pdf?src-supplier=Digikey; ComponentLink6URL: https://datasheet.ciiva.com/2465/dcrcwe3-2465543.pdf?src-supplier=Digikey; ComponentLink6Description: https://datasheet.ciiva.com/2465/dcrcwe3-2465543.pdf?src-supplier=Digikey; ComponentLink7URL: https://datasheet.ciiva.com/16721/70201119-16721486.pdf?src-supplier=Allied+Electronics; ComponentLink7Description: https://datasheet.ciiva.com/16721/70201119-16721486.pdf?src-supplier=Allied+Electronics; ComponentLink8URL: https://datasheet.ciiva.com/16787/70201119-16787964.pdf?src-supplier=Allied+Electronics; ComponentLink8Description: https://datasheet.ciiva.com/16787/70201119-16787964.pdf?src-supplier=Allied+Electronics; ComponentLink9URL: https://datasheet.ciiva.com/5550/dcrcwe3-109170-5550286.pdf?src-supplier=Mouser; ComponentLink9Description: https://datasheet.ciiva.com/5550/dcrcwe3-109170-5550286.pdf?src-supplier=Mouser; ComponentLink10URL: https://datasheet.ciiva.com/16199/dcrcwe3-16199102.pdf?src-supplier=Future+Electronics; ComponentLink10Description: https://datasheet.ciiva.com/16199/dcrcwe3-16199102.pdf?src-supplier=Future+Electronics
R53 R54 R63 R64 = RC1206FR-0710RL: RES 10 OHM 1% 1/4W 1206; Manufacturer: Yageo; Item Type: Resistor; Voltage Rating (AC): 200V; Supplier: Avnet; LCSC Part Number: C108080; Manufacturer Part Number: RC1206FR-0710RL; RoHS: Yes; Stock: 3696; Pricing: 1=0.125, 25=0.043, 50=0.034, 100=0.026 (USD); Lead Free: 5697LeadFree; ComponentLink1URL: https://datasheet.ciiva.com/11819/0900766b80c6630a-11819896.pdf?src-supplier=Rs; ComponentLink1Description: https://datasheet.ciiva.com/11819/0900766b80c6630a-11819896.pdf?src-supplier=Rs; ComponentLink2URL: https://datasheet.ciiva.com/22735/444357-22735648.pdf?src-supplier=Farnell; ComponentLink2Description: https://datasheet.ciiva.com/22735/444357-22735648.pdf?src-supplier=Farnell; ComponentLink3URL: https://datasheet.ciiva.com/29181/402303-da-01-en-smd-widerstand-chip1206-10-ohm-29181572.pdf?src-supplier=Conrad; ComponentLink3Description: https://datasheet.ciiva.com/29181/402303-da-01-en-smd-widerstand-chip1206-10-ohm-29181572.pdf?src-supplier=Conrad; ComponentLink4URL: https://datasheet.ciiva.com/2460/pyu-rc1206-51-rohs-l-4-2460048.pdf?src-supplier=Digikey; ComponentLink4Description: https://datasheet.ciiva.com/2460/pyu-rc1206-51-rohs-l-4-2460048.pdf?src-supplier=Digikey; ComponentLink5URL: https://datasheet.ciiva.com/2460/pyu-rc1206-51-rohs-l-4-2460049.pdf?src-supplier=Digikey; ComponentLink5Description: https://datasheet.ciiva.com/2460/pyu-rc1206-51-rohs-l-4-2460049.pdf?src-supplier=Digikey; ComponentLink6URL: https://datasheet.ciiva.com/2460/pyu-rc1206-51-rohs-l-4-2460050.pdf?src-supplier=Digikey; ComponentLink6Description: https://datasheet.ciiva.com/2460/pyu-rc1206-51-rohs-l-4-2460050.pdf?src-supplier=Digikey; ComponentLink7URL: https://datasheet.ciiva.com/46445/444357-46445704.pdf?src-supplier=Element14; ComponentLink7Description: https://datasheet.ciiva.com/46445/444357-46445704.pdf?src-supplier=Element14; ComponentLink8URL: https://datasheet.ciiva.com/16962/pyu-rc1206-51-rohs-l-4-16962857.pdf?src-supplier=Future+Electronics; ComponentLink8Description: https://datasheet.ciiva.com/16962/pyu-rc1206-51-rohs-l-4-16962857.pdf?src-supplier=Future+Electronics
R56 R59 R73-R76 = FRC1206F2R21TS: 250mW Thick Film Resistors 200V ±200ppm/℃ ±1% 2.21Ω 1206 Chip Resistor - Surface Mount ROHS; Manufacturer: FOJAN; Manufacturer Part Number: FRC1206F2R21TS; Package: 1206; LCSC Part Number: C5126181; Item Type: Resistor; ComponentLink1Description: LCSC; ComponentLink1URL: https://www.lcsc.com/product-detail/Chip-Resistor-Surface-Mount_FOJAN-FRC1206F2R21TS_C5126181.html
R68 = RTO020F10000JTE3: RES 1K OHM 20W 5% TO220; Manufacturer: Vishay Sfernice; Item Type: Resistors; Voltage Rating (AC): 250V; Supplier: Digikey; Supplier Part Number: RT20J-1.0K-ND; Manufacturer Part Number: RTO020F10000JTE3; RoHS: Yes; Stock: 50; Pricing: 1=13, 10=8.931, 50=7.3644, 100=6.8873, 500=6.09046, 1000=5.84687 (USD); ComponentLink1URL: https://datasheet.ciiva.com/7983/425987-7983241.pdf?src-supplier=Element14; ComponentLink1Description: https://datasheet.ciiva.com/7983/425987-7983241.pdf?src-supplier=Element14; ComponentLink2URL: https://datasheet.ciiva.com/8881/rto20-8881142.pdf?src-supplier=Avnet; ComponentLink2Description: https://datasheet.ciiva.com/8881/rto20-8881142.pdf?src-supplier=Avnet; ComponentLink3URL: https://datasheet.ciiva.com/2764/rto20-2764239.pdf?src-supplier=Digikey; ComponentLink3Description: https://datasheet.ciiva.com/2764/rto20-2764239.pdf?src-supplier=Digikey
R77 R82 = RT0603BRD07165KL: RES SMD 165K OHM 0.1% 1/10W 0603; Manufacturer: Yageo; Voltage Rating: 75V; Value: 165kR; Power Rating: 100mW; Temperature Coefficient: 25ppm/°C; Voltage Rating (DC): 50V; Item Type: Resistor; Supplier 1: Avnet; Manufacturer Part Number: RT0603BRD07165KL; RoHS: Yes; Category: Chip SMD Resistors; Stock 1: 5000; Pricing 1: 5000=0.02327, 10000=0.02294, 20000=0.02227 (USD); Case/Package: 0603; Case Code (Metric): 1608; Case Code (Imperial): 0603; Min Operating Temperature: -55°C; Max Operating Temperature: 155°C; Tolerance: 0.1%; Packaging: Tape and Reel; Package Quantity: 5000; Resistor Type: Thin Film; Number of Terminations: 2; Termination: SMD/SMT; Max Power Dissipation: 100mW; Features: Moisture Resistant; Series: RT; Length: 0.063inch; Width: 0.031inch; Height: 0.022inch; Lead Free: Lead Free; RoHS Compliant: Yes; ComponentLink1URL: https://datasheet.ciiva.com/12704/pyu-rt-1-to-0-05-rohs-l-4-12704968.pdf?src-supplier=Mouser; ComponentLink1Description: https://datasheet.ciiva.com/12704/pyu-rt-1-to-0-05-rohs-l-4-12704968.pdf?src-supplier=Mouser; ComponentLink2URL: https://datasheet.ciiva.com/46635/pyu-rt-1-to-0-05-rohs-l-5-46635005.pdf?src-supplier=Digi-Key; ComponentLink2Description: https://datasheet.ciiva.com/46635/pyu-rt-1-to-0-05-rohs-l-5-46635005.pdf?src-supplier=Digi-Key; ComponentLink3URL: https://datasheet.ciiva.com/2585/pyu-rt-1-to-0-05-rohs-l-4-2585694.pdf?src-supplier=Digi-Key; ComponentLink3Description: https://datasheet.ciiva.com/2585/pyu-rt-1-to-0-05-rohs-l-4-2585694.pdf?src-supplier=Digi-Key; Supplier Part Number 1: RT0603BRD07165KL; LCSC Part Number: C861150
R78 R80 = CRCW06031K00FKEA: RES SMD 1K OHM 1% 1/10W 0603; Manufacturer: Vishay Dale; Item Type: Resistor; Value: 1kR; Voltage Rating: 75V; Temperature Coefficient: 100ppm/°C; Power Rating: 100mW; LCSC Part Number: C844920; ComponentLink2URL: https://datasheet.ciiva.com/11808/0900766b80d98afc-11808625.pdf?src-supplier=Rs; ComponentLink2Description: https://datasheet.ciiva.com/11808/0900766b80d98afc-11808625.pdf?src-supplier=Rs; ComponentLink3URL: https://datasheet.ciiva.com/46441/1720486-46441623.pdf?src-supplier=Element14; ComponentLink3Description: https://datasheet.ciiva.com/46441/1720486-46441623.pdf?src-supplier=Element14; ComponentLink4URL: https://datasheet.ciiva.com/46441/1720486-46441622.pdf?src-supplier=Element14; ComponentLink4Description: https://datasheet.ciiva.com/46441/1720486-46441622.pdf?src-supplier=Element14; ComponentLink5URL: https://datasheet.ciiva.com/26316/fld-crcw-e3-data-en-26316551.pdf?src-supplier=Distrelec; ComponentLink5Description: https://datasheet.ciiva.com/26316/fld-crcw-e3-data-en-26316551.pdf?src-supplier=Distrelec; ComponentLink6URL: https://datasheet.ciiva.com/2465/dcrcwe3-2465536.pdf?src-supplier=Digi-Key; ComponentLink6Description: https://datasheet.ciiva.com/2465/dcrcwe3-2465536.pdf?src-supplier=Digi-Key; ComponentLink7URL: https://datasheet.ciiva.com/2465/dcrcwe3-2465534.pdf?src-supplier=Digi-Key; ComponentLink7Description: https://datasheet.ciiva.com/2465/dcrcwe3-2465534.pdf?src-supplier=Digi-Key; ComponentLink8URL: https://datasheet.ciiva.com/16199/dcrcwe3-16199053.pdf?src-supplier=Future+Electronics; ComponentLink8Description: https://datasheet.ciiva.com/16199/dcrcwe3-16199053.pdf?src-supplier=Future+Electronics; ComponentLink9URL: https://datasheet.ciiva.com/46385/1697337-46385497.pdf?src-supplier=Element14; ComponentLink9Description: https://datasheet.ciiva.com/46385/1697337-46385497.pdf?src-supplier=Element14; ComponentLink10URL: https://datasheet.ciiva.com/2465/dcrcwe3-2465535.pdf?src-supplier=Digi-Key; ComponentLink10Description: https://datasheet.ciiva.com/2465/dcrcwe3-2465535.pdf?src-supplier=Digi-Key; ComponentLink11URL: https://datasheet.ciiva.com/8336/dcrcwe3-8336822.pdf?src-supplier=Avnet; ComponentLink11Description: https://datasheet.ciiva.com/8336/dcrcwe3-8336822.pdf?src-supplier=Avnet; ComponentLink12URL: https://datasheet.ciiva.com/3257/dcrcwe3-3257132.pdf?src-supplier=Avnet; ComponentLink12Description: https://datasheet.ciiva.com/3257/dcrcwe3-3257132.pdf?src-supplier=Avnet; Supplier: Mouser; Supplier Part Number: 71-CRCW0603-1.0K-E3; Manufacturer Part Number: CRCW06031K00FKEA; RoHS: Yes; Category: Chip SMD Resistors; Stock: 1295653; Pricing: 1=0.1, 10=0.017, 50=0.017, 100=0.01, 1000=0.008, 10000=0.004 (USD); Case/Package: 0603; Pins: 2; Contact Plating: Tin; Weight: 7.1E-05oz; Case Code (Metric): 1608; Case Code (Imperial): 0603; Min Operating Temperature: -55°C; Max Operating Temperature: 155°C; Tolerance: 1%; Resistor Type: Thick Film; Packaging: Tape and Reel; Package Quantity: 5000; Number of Terminations: 2; Termination: SMD/SMT; Max Power Dissipation: 100mW; Features: Automotive AEC-Q200; Series: CRCW; Technology: THICK FILM; Resistance Tolerance: 1%; Voltage Rating (DC): 75V; Construction: Rectangular; Length: 1.55mm; Width: 0.85mm; Height: 0.45mm; Depth: 0.85mm; Ratings: AEC-Q200; Radiation Hardening: No; RoHS Compliant: Yes; Reach SVHC Compliant: Unknown; Lead Free: 5697LeadFree; Military Standard: Not; ComponentLink1URL: https://datasheet.ciiva.com/11808/0900766b80d98afc-11808625.pdf?src-supplier=Rs; ComponentLink1Description: https://datasheet.ciiva.com/11808/0900766b80d98afc-11808625.pdf?src-supplier=Rs; ComponentLink13URL: https://datasheet.ciiva.com/2465/dcrcwe3-2465535.pdf?src-supplier=Digikey; ComponentLink13Description: https://datasheet.ciiva.com/2465/dcrcwe3-2465535.pdf?src-supplier=Digikey; ComponentLink14URL: https://datasheet.ciiva.com/2465/dcrcwe3-2465536.pdf?src-supplier=Digikey; ComponentLink14Description: https://datasheet.ciiva.com/2465/dcrcwe3-2465536.pdf?src-supplier=Digikey; ComponentLink15URL: https://datasheet.ciiva.com/2465/dcrcwe3-2465534.pdf?src-supplier=Digikey; ComponentLink15Description: https://datasheet.ciiva.com/2465/dcrcwe3-2465534.pdf?src-supplier=Digikey
R79 = BVR-Z-R0002-1.0: RESISTOR - ISA-WELD SHUNT, 0.000; Manufacturer: Isabellenhütte; Supplier: Digikey; Supplier Part Number: 4423-BVR-Z-R0002-1.0CT-ND; Manufacturer Part Number: BVR-Z-R0002-1.0; RoHS: Yes; Item Type: RESISTOR; Stock: 3918; Pricing: 1=5.08, 10=3.052, 25=2.5316, 50=2.2122, 100=1.9452, 250=1.65756, 500=1.5125 (USD)
T2 T3 = 56PR3362: Gate Drive Transformer; Manufacturer: Vitec; Manufacturer Part Number: 56P3362; Package: Custom; LCSC Part Number: -; Item Type: Transformer; ComponentLink1Description: LCSC; ComponentLink1URL: *
T4 = PQ50-50 145400-A: Manufacturer: Texas Instruments; Item Type: Transformer; Manufacturer Part Number: PQ50-50 145400-A; Package: Custom; LCSC Part Number: -; ComponentLink1Description: Supplier; ComponentLink1URL: https://www.bourns.com/products/magnetic-products/kaschke-components
U11 U12 U14 U15 = UCC27524DGN: IC GATE DRVR LOW-SIDE 8MSOP; Manufacturer: Texas Instruments; Supplier: Mouser; Supplier Part Number: 595-UCC27524DGN; Manufacturer Part Number: UCC27524DGN; RoHS: Yes; Item Type: IC; Stock: 6831; Pricing: 1=2.55, 10=1.85, 50=1.85, 100=1.41, 1000=1.25, 10000=1.05 (USD); ComponentLink1URL: https://datasheet.ciiva.com/15110/getdatasheetpartid-551635-15110694.pdf?src-supplier=Verical; ComponentLink1Description: https://datasheet.ciiva.com/15110/getdatasheetpartid-551635-15110694.pdf?src-supplier=Verical; ComponentLink2URL: https://datasheet.ciiva.com/7977/1806027-7977576.pdf?src-supplier=Element14; ComponentLink2Description: https://datasheet.ciiva.com/7977/1806027-7977576.pdf?src-supplier=Element14; ComponentLink3URL: https://datasheet.ciiva.com/6614/ucc27524-6614166.pdf?src-supplier=Digikey; ComponentLink3Description: https://datasheet.ciiva.com/6614/ucc27524-6614166.pdf?src-supplier=Digikey; ComponentLink4URL: https://datasheet.ciiva.com/14266/ucc27523-14266646.pdf?src-supplier=Avnet; ComponentLink4Description: https://datasheet.ciiva.com/14266/ucc27523-14266646.pdf?src-supplier=Avnet
U13 = OPA378AIDBVR: IC OPAMP ZER-DRIFT 1CIRC SOT23-5; Manufacturer: Texas Instruments; Supplier: Mouser; Manufacturer Part Number: OPA378AIDBVR; RoHS: Yes; Item Type: IC; Stock: 1753; Pricing: 1=1.96, 10=1.35, 50=1.35, 100=1.18, 1000=0.992, 10000=0.911 (USD); ComponentLink1URL: https://datasheet.ciiva.com/14463/sbos417d-14463248.pdf?src-supplier=Avnet; ComponentLink1Description: https://datasheet.ciiva.com/14463/sbos417d-14463248.pdf?src-supplier=Avnet; ComponentLink2URL: https://datasheet.ciiva.com/1813/opa2378-1813508.pdf?src-supplier=Digikey; ComponentLink2Description: https://datasheet.ciiva.com/1813/opa2378-1813508.pdf?src-supplier=Digikey